# EasyEDA Pro project laterscreen.eprj, board PCB1
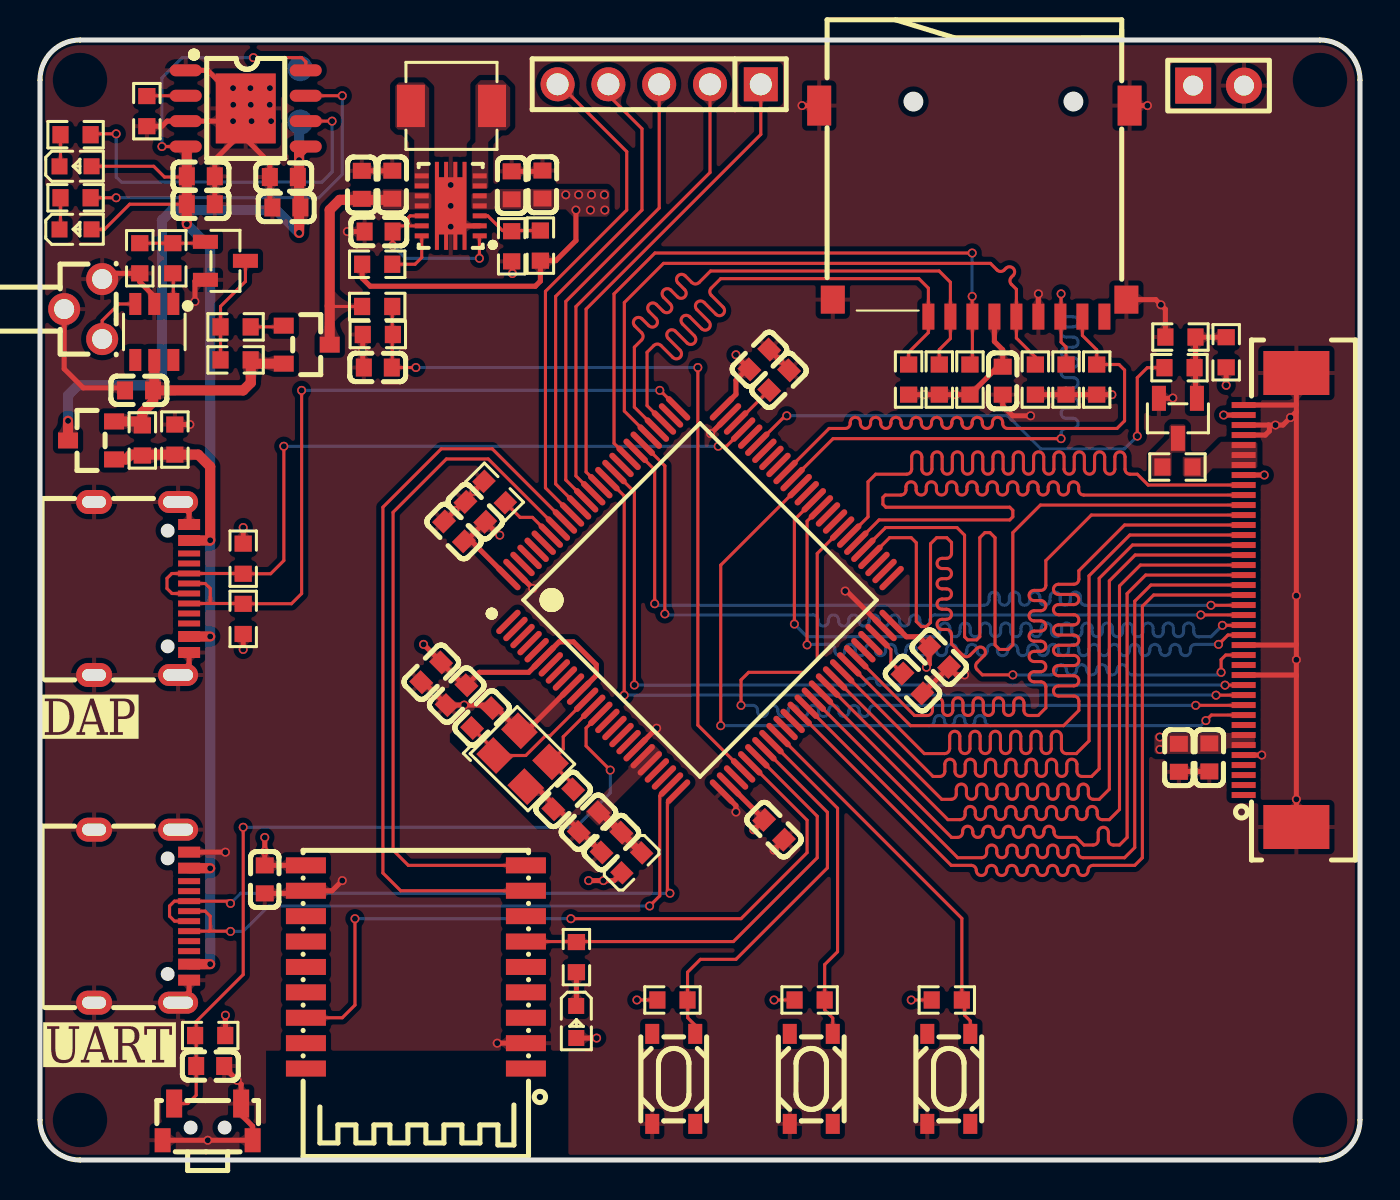
[diagram p3: board, top side]
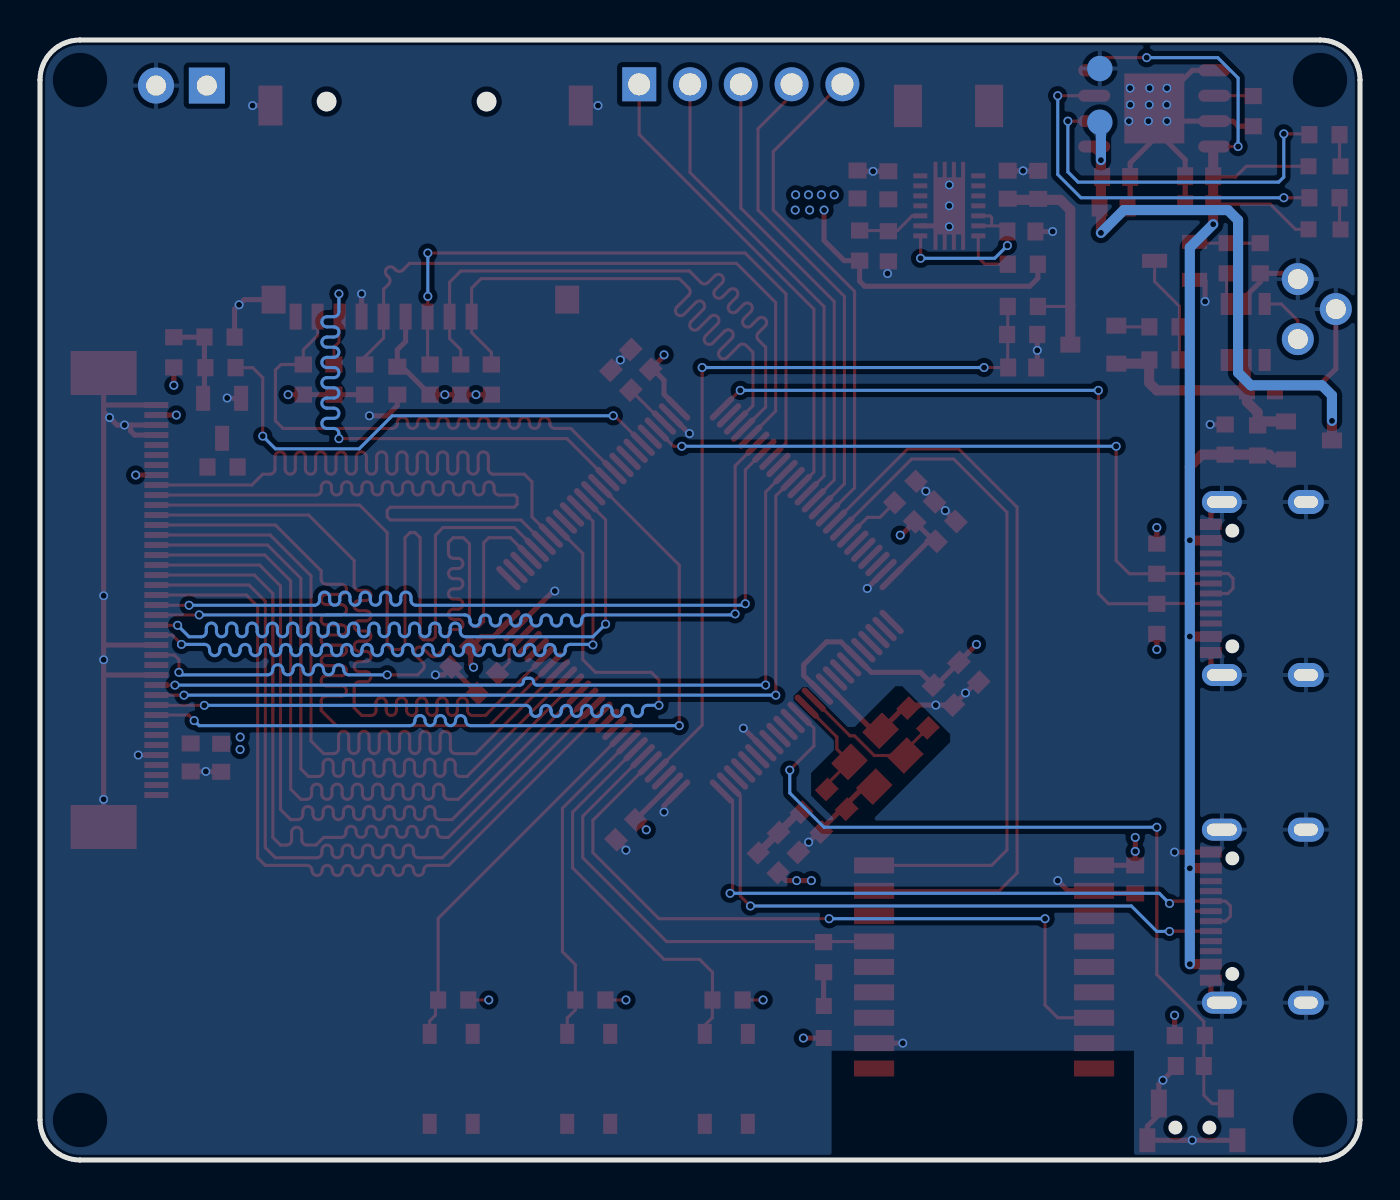
[diagram p4: board, bottom side, seen from below]

Outline 66 x 56 mm; copper layers: Top Layer, Inner1, Inner2, Bottom Layer. Coordinates in mm from the lower left corner of the outline.
Outline path: 0,54 0,2 arc(0.59,0.59) 2,0 64,0 arc(65.41,0.59) 66,2 66,54 arc(65.41,55.41) 64,56 2,56 arc(0.59,55.41) 0,54
Stack: Top Layer 0.035mm 外层铜厚1oz / Dielectric1 0.2104mm 7628 RC49% 8.6mil / Inner1 0.0152mm 内层铜厚 / Dielectric2 1.065mm 1.1mm H/HOZ Copper / Inner2 0.0152mm 内层铜厚 / Dielectric3 0.2104mm 7628 RC49% 8.6mil / Bottom Layer 0.035mm 外层铜厚1oz

## Design rules (mm)
template: 自定义配置
spacing copperThickness1oz (default): track to track 0.102, other pairs 0.089 to 0.3
spacing copperThickness2oz: track to track 0.203, other pairs 0.152 to 0.3
track width copperThickness1oz (default): min 0.102, default 0.155, max 2.54
track width copperThickness2oz: min 0.203, default 0.254, max 2.54
differential pair differentialPair (default): width min 0.127, default 0.254, max 2.54; gap min 0.152, default 0.152
via viaSize (default): diameter min 0.432, default 0.45, max 10; hole min 0.3, default 0.3, max 6.299
net FMC_NE1 uses LCD
net FMC_A16 uses LCD
net FMC_NWE uses LCD
net FMC_NOE uses LCD
net PB15 uses LCD
net FMC_D0 uses LCD
net FMC_D1 uses LCD
net FMC_D2 uses LCD
net FMC_D3 uses LCD
net FMC_D4 uses LCD
net FMC_D5 uses LCD
net FMC_D6 uses LCD
net FMC_D7 uses LCD
net FMC_D8 uses LCD
net FMC_D9 uses LCD
net FMC_D10 uses LCD
net FMC_D11 uses LCD
net FMC_D12 uses LCD
net FMC_D13 uses LCD
net FMC_D14 uses LCD
net FMC_D15 uses LCD
eq len grp LCD uses LCD

## Placement (name value [footprint] x y rotation side)
C20  100nF  [C0603]  20.83 23.24 225 top
C21  2.2uF  [C0603]  36.96 38.99 45 top
C22  100nF  [C0603]  19.56 24.38 225 top
C23  100nF  [C0603]  20.7 31.43 135 top
C24  2.2uF  [C0603]  43.62 23.83 135 top
C25  100nF  [C0603]  27.43 16.89 45 top
C26  10uF  [C0603]  28.57 15.88 45 top
C27  100nF  [C0603]  36.7 16.51 315 top
C28  100nF  [C0603]  35.97 40.03 225 top
C29  100nF  [C0603]  44.96 25.15 135 top
C30  22pF  [C0603]  22.1 22.1 225 top
C31  22pF  [C0603]  26.16 18.03 45 top
C32  1uF  [C0603]  8.51 4.7 180 top
C38  100nF  [C0603]  11.24 14.03 90 top
C39  100nF  [C0603]  58.47 20.13 90 top
C40  100nF  [C0603]  56.94 20.11 270 top
C42  100nF  [C0603]  48.14 38.97 90 top
C43  100nF  [C0603]  21.77 32.41 315 top
C94  100nF  [C0603]  4.95 38.48 0 top
C96  100nF  [C0603]  16.89 39.62 0 top
C99  100nF  [C0603]  16.09 48.76 90 top
C100  10uF  [C0603]  17.61 48.77 90 top
C101  100nF  [C0603]  16.93 46.42 180 top
C102  100nF  [C0603]  25.12 48.77 90 top
C103  10uF  [C0603]  23.58 48.73 90 top
C104  100nF  [C0603]  12.19 49.15 0 top
C105  10uF  [C0603]  12.32 47.62 0 top
C106  100nF  [C0603]  8.04 47.79 180 top
C107  10uF  [C0603]  8.04 49.19 180 top
CARD1  TF-01A  [TF-SMD_TF-01A]  46.72 47.44 180 top
FPC1  AFC07-S40ECA-00  [FPC-SMD_P0.50-40P_LCS-SJ-H2.0]  61.5 28 270 top
H1  -  [HDR-TH_5P-P2.54-V-M]  30.96 53.79 180 top
H2  -  [HDR-TH_2P-P2.54-V-M-1]  58.93 53.72 0 top
L1  2.2uH  [IND-SMD_L4.4-W4.2]  20.57 52.7 0 top
L3  MPZ1608S181ATAH0  [L0603]  29.59 14.86 45 top
LED2  -  [LED_0603]  26.82 6.85 270 top
LED3  -  [LED_0603]  1.83 49.69 0 top
LED4  -  [LED_0603]  1.83 46.54 0 top
Q2  SS8050  [SOT-23-3_L2.9-W1.3-P1.90-LS2.4-BR]  56.9 37.08 90 top
Q3  AO3401A  [SOT-23_L2.9-W1.3-P1.90-LS2.4-BR]  13.34 40.77 180 top
Q4  AO3401A  [SOT-23_L2.9-W1.3-P1.90-LS2.4-BR]  2.55 35.98 0 top
R3  10kΩ  [R0603]  5.34 52.44 90 top
R8  10K  [R0603]  10.16 30.07 90 top
R10  10K  [R0603]  10.16 27.06 270 top
R17  10K  [R0603]  44.96 39.02 270 top
R18  10K  [R0603]  43.43 39.02 270 top
R19  10K  [R0603]  52.84 39.02 270 top
R20  10K  [R0603]  51.3 39.02 270 top
R24  10K  [R0603]  22.73 33.4 315 top
R25  10K  [R0603]  8.51 6.22 0 top
R32  2R2  [R0603]  56.87 34.65 0 top
R33  10K  [R0603]  59.31 40.39 270 top
R34  1K  [R0603]  56.98 39.62 0 top
R35  10K  [R0603]  57.02 41.15 0 top
R36  2K  [R0603]  26.82 10.14 270 top
R37  10K  [R0603]  46.5 39.02 270 top
R38  10K  [R0603]  49.77 39.02 270 top
R91  680R  [R0603]  1.78 48.11 180 top
R92  680R  [R0603]  1.78 51.27 180 top
R100  10K  [R0603]  9.78 40 0 top
R101  10K  [R0603]  4.99 45.09 90 top
R102  1K  [R0603]  6.64 45.09 90 top
R103  1K  [R0603]  9.78 41.66 180 top
R112  10K  [R0603]  45.34 8 180 top
R113  5K  [R0603]  16.86 42.68 0 top
R114  20K  [R0603]  16.89 41.28 0 top
R122  0  [R0603]  5.12 35.98 90 top
R123  1M  [R0603]  16.86 44.79 0 top
R124  1M  [R0603]  25.02 45.72 270 top
R125  180K  [R0603]  23.58 45.69 90 top
R126  10kΩ  [R0603]  6.74 36.02 270 top
R127  10K  [R0603]  38.48 8 180 top
R128  10K  [R0603]  31.62 8 180 top
SW2  TS24CA 250gf 013  [SW-SMD_L4.7-W3.5-P3.35-EH]  8.38 1.91 180 top
SW3  TS3425BA  [SW-SMD_4P-L4.2-W3.2-P2.15-LS4.6-1]  38.56 4.06 90 top
SW4  GT-TCB73B-H090-L1  [SW-TH_G-SWITCH_GT-TCB73B-H090-L1]  2.16 42.55 270 top
SW5  TS3425BA  [SW-SMD_4P-L4.2-W3.2-P2.15-LS4.6-1]  45.44 4.06 90 top
SW6  TS3425BA  [SW-SMD_4P-L4.2-W3.2-P2.15-LS4.6-1]  31.69 4.06 90 top
TP10  -  [Test-Point-0.5mm]  13.01 51.89 0 top
TP11  -  [Test-Point-0.5mm]  13.01 54.57 0 top
U3  STM32H743VIT6  [LQFP-100_L14.0-W14.0-P0.50-LS16.0-BL]  33 28 315 top
U11  TP4056X-42-ESOP8  [SOP-8_L4.9-W3.9-P1.27-LS6.0-TL-EP]  10.29 52.58 0 top
U23  SS8050  [SOT-23-3_L2.9-W1.3-P1.90-LS2.4-BR]  9.27 44.96 180 top
U24  -  [SOT-23-6_L2.9-W1.6-P0.95-LS2.7-BR]  5.72 41.4 90 top
U29  TPS63020DSJR  [VSON-14_L4.0-W3.0-P0.50-BL-EP_TI_DSJ]  20.54 47.71 90 top
U30  RC6621A  [BULETM-SMD_18P-L15.2-W11.2-P1.27]  18.8 9.65 180 top
USB1  TYPE-C 16PIN 2MD(073)  [USB-C-SMD_TYPE-C-6PIN-2MD-073]  5.08 28.58 270 top
USB2  TYPE-C 16PIN 2MD(073)  [USB-C-SMD_TYPE-C-6PIN-2MD-073]  5.08 12.19 270 top
X2  12MHz  [OSC-SMD_4P-L3.2-W2.5-BL]  24.13 20.07 315 top

## Footprints (pads in the part's own frame, mm; a bottom-side part is the same pattern mirrored in y, then rotated)
BULETM-SMD_18P-L15.2-W11.2-P1.27
  rect 2x0.8 smd: 1(-5.5,5.08) 2(-5.5,3.81) 3(-5.5,2.54) 4(-5.5,1.27) 5(-5.5,0) 6(-5.5,-1.27) 7(-5.5,-2.54) 8(-5.5,-3.81) 9(-5.5,-5.08) 10(5.5,-5.08) 11(5.5,-3.81) 12(5.5,-2.54) 13(5.5,-1.27) 14(5.5,0) 15(5.5,1.27) 16(5.5,2.54) 17(5.5,3.81) 18(5.5,5.08)
C0603
  rect 0.8x0.9 smd: 1(-0.7,0) 2(0.7,0)
FPC-SMD_P0.50-40P_LCS-SJ-H2.0
  rect 0.3x1.2 smd: 1(9.751,-1.318) 2(9.252,-1.318) 3(8.753,-1.318) 4(8.252,-1.318) 5(7.752,-1.318) 6(7.252,-1.318) 7(6.752,-1.318) 8(6.251,-1.318) 9(5.753,-1.318) 10(5.253,-1.318) 11(4.753,-1.318) 12(4.252,-1.318) 13(3.752,-1.318) 14(3.251,-1.318) 15(2.752,-1.318) 16(2.253,-1.318) 17(1.752,-1.318) 18(1.252,-1.318) 19(0.752,-1.318) 20(0.252,-1.318) 21(-0.249,-1.318) 22(-0.748,-1.318) 23(-1.247,-1.318) 24(-1.748,-1.318) 25(-2.248,-1.318) 26(-2.748,-1.318) 27(-3.248,-1.318) 28(-3.749,-1.318) 29(-4.247,-1.318) 30(-4.747,-1.318) 31(-5.247,-1.318) 32(-5.748,-1.318) 33(-6.248,-1.318) 34(-6.749,-1.318) 35(-7.248,-1.318) 36(-7.747,-1.318) 37(-8.248,-1.318) 38(-8.748,-1.318) 39(-9.248,-1.318) 40(-9.748,-1.318)
  rect 2.2x3.3 smd: 41(11.35,1.318) 42(-11.35,1.318)
HDR-TH_2P-P2.54-V-M-1
  rect 1.8x1.8 hole 1: 1(-1.27,0)
  round 1.8 hole 1: 2(1.27,0)
HDR-TH_5P-P2.54-V-M
  rect 1.7x1.7 hole 1.1: 1(-5.08,0)
  round 1.7 hole 1.1: 2(-2.54,0) 3(0,0) 4(2.54,0) 5(5.08,0)
IND-SMD_L4.4-W4.2
  rect 1.4x2.12 smd: 1(2.028,0) 2(-2.028,0)
L0603
  rect 0.8x0.864 smd: 1(-0.7,0) 2(0.7,0)
LED_0603
  rect 0.8x0.8 smd: 1(-0.851,-0.01) 2(0.75,-0.005)
LQFP-100_L14.0-W14.0-P0.50-LS16.0-BL
  oval 0.3x1.6 smd: 1(-6,-7.55) 2(-5.5,-7.55) 3(-5,-7.55) 4(-4.5,-7.55) 5(-4,-7.55) 6(-3.5,-7.55) 7(-3,-7.55) 8(-2.5,-7.55) 9(-2,-7.55) 10(-1.5,-7.55) 11(-1,-7.55) 12(-0.5,-7.55) 13(0,-7.55) 14(0.5,-7.55) 15(1,-7.55) 16(1.5,-7.55) 17(2,-7.55) 18(2.5,-7.55) 19(3,-7.55) 20(3.5,-7.55) 21(4,-7.55) 22(4.5,-7.55) 23(5,-7.55) 24(5.5,-7.55) 25(6,-7.55) 51(6,7.55) 52(5.5,7.55) 53(5,7.55) 54(4.5,7.55) 55(4,7.55) 56(3.5,7.55) 57(3,7.55) 58(2.5,7.55) 59(2,7.55) 60(1.5,7.55) 61(1,7.55) 62(0.5,7.55) 63(0,7.55) 64(-0.5,7.55) 65(-1,7.55) 66(-1.5,7.55) 67(-2,7.55) 68(-2.5,7.55) 69(-3,7.55) 70(-3.5,7.55) 71(-4,7.55) 72(-4.5,7.55) 73(-5,7.55) 74(-5.5,7.55) 75(-6,7.55)
  oval 1.6x0.3 smd: 26(7.55,-6) 27(7.55,-5.5) 28(7.55,-5) 29(7.55,-4.5) 30(7.55,-4) 31(7.55,-3.5) 32(7.55,-3) 33(7.55,-2.5) 34(7.55,-2) 35(7.55,-1.5) 36(7.55,-1) 37(7.55,-0.5) 38(7.55,0) 39(7.55,0.5) 40(7.55,1) 41(7.55,1.5) 42(7.55,2) 43(7.55,2.5) 44(7.55,3) 45(7.55,3.5) 46(7.55,4) 47(7.55,4.5) 48(7.55,5) 49(7.55,5.5) 50(7.55,6) 76(-7.55,6) 77(-7.55,5.5) 78(-7.55,5) 79(-7.55,4.5) 80(-7.55,4) 81(-7.55,3.5) 82(-7.55,3) 83(-7.55,2.5) 84(-7.55,2) 85(-7.55,1.5) 86(-7.55,1) 87(-7.55,0.5) 88(-7.55,0) 89(-7.55,-0.5) 90(-7.55,-1) 91(-7.55,-1.5) 92(-7.55,-2) 93(-7.55,-2.5) 94(-7.55,-3) 95(-7.55,-3.5) 96(-7.55,-4) 97(-7.55,-4.5) 98(-7.55,-5) 99(-7.55,-5.5) 100(-7.55,-6)
OSC-SMD_4P-L3.2-W2.5-BL
  rect 1.4x1.2 smd: 1(-1.1,-0.875) 2(1.1,-0.875) 3(1.1,0.875) 4(-1.1,0.875)
R0603
  rect 0.806x0.864 smd: 1(-0.753,0) 2(0.753,0)
SOP-8_L4.9-W3.9-P1.27-LS6.0-TL-EP
  oval 1.6x0.6 smd: 1(-3,1.905) 2(-3,0.635) 3(-3,-0.635) 4(-3,-1.905) 5(3,-1.905) 6(3,-0.635) 7(3,0.635) 8(3,1.905)
  rect 3x3.5 smd: 9(0,0)
SOT-23-3_L2.9-W1.3-P1.90-LS2.4-BR
  rect 1.25x0.7 smd: 1(1,-0.95) 2(1,0.95) 3(-1,0)
SOT-23-6_L2.9-W1.6-P0.95-LS2.7-BR
  rect 1.1x0.6 smd: 1(1.4,-0.95) 2(1.4,0) 3(1.4,0.95) 4(-1.4,0.95) 5(-1.4,0) 6(-1.4,-0.95)
SOT-23_L2.9-W1.3-P1.90-LS2.4-BR
  rect 1x0.8 smd: 1(1.15,-0.95) 2(1.15,0.95) 3(-1.15,0)
SW-SMD_4P-L4.2-W3.2-P2.15-LS4.6-1
  rect 1x0.7 smd: 1(-2.25,1.075) 2(2.25,1.075) 3(-2.25,-1.075) 4(2.25,-1.075)
SW-SMD_L4.7-W3.5-P3.35-EH
  rect 0.8x1.4 smd: 1(-1.675,-0.917) 2(1.675,-0.917)
  rect 0.8x1.2 smd: 3(-2.25,0.917) 4(2.25,0.917)
SW-TH_G-SWITCH_GT-TCB73B-H090-L1
  round 1.6 hole 1: 1(-1.5,0.95) 2(1.5,0.95) 3(0,-0.95)
Test-Point-0.5mm
  round 1.27 smd far side: 1(0,0)
TF-SMD_TF-01A
  rect 0.6x1.3 smd: 1(2.3,5.276) 2(1.2,5.276) 3(0.101,5.276) 4(-1,5.276) 5(-2.099,5.276) 6(-3.2,5.276) 7(-4.3,5.276) 8(-5.399,5.276) 9(-6.5,5.276)
  rect 1.2x1.4 smd: 10(-7.599,4.426) 13(7.08,4.426)
  rect 1.2x2 smd: 11(-7.76,-5.276) 12(7.76,-5.276)
USB-C-SMD_TYPE-C-6PIN-2MD-073
  rect 0.55x1.1 smd: 1(-3.2,2.375) 2(-2.4,2.375) 11(2.4,2.375) 12(3.2,2.375)
  rect 0.3x1.1 smd: 3(-1.75,2.375) 4(-1.25,2.375) 5(-0.75,2.375) 6(-0.25,2.375) 7(0.25,2.375) 8(0.75,2.375) 9(1.25,2.375) 10(1.75,2.375)
  oval 1.1x2 hole 0.6x1.5: 13(-4.325,1.825) 14(4.325,1.825)
  oval 1.2x1.8 hole 0.6x1.2: 13(-4.325,-2.375) 14(4.325,-2.375)
VSON-14_L4.0-W3.0-P0.50-BL-EP_TI_DSJ
  rect 0.25x0.7 smd: 1(-1.5,-1.45) 2(-1,-1.45) 3(-0.5,-1.45) 4(0,-1.45) 5(0.5,-1.45) 6(1,-1.45) 7(1.5,-1.45) 8(1.5,1.45) 9(1,1.45) 10(0.5,1.45) 11(0,1.45) 12(-0.5,1.45) 13(-1,1.45) 14(-1.5,1.45)
  custom 4.4x1.58 smd: 15(0,0)

## Nets
As in the schematic.

Pads without a net: CARD1 9; FPC1 1 2 3 4 8 14; SW3 2 3; SW5 2 3; SW6 2 3; U3 1 2 3 4 5 7 8 9 15 16 17 18 22 23 28 35 36 46 47 51 52 53 59 60 63 67 68 69 71 77 84 95 96 97 98; U24 4 6; U30 1 3 4 5 7 12 13 14 15 17 18; USB1 3 4 9 10; USB2 3 4 9 10

## Via types
v1: diameter 0.45, hole 0.299, Top Layer to Bottom Layer, 135 vias

## Routing (per net, layer and track width the routed paths; a pad name or vN(x,y) marks a point on that pad's centre or on a via; arc(x,y) is an arc through that point)
5V: length 11.7
  Top Layer w0.155: R113.1 14.51,42.68 14.49,42.7
  Top Layer w0.508: Q3.3 14.49,47.5 14.99,48.01 17.56,48.01 C100.1
+5V: length 12.9
  Top Layer w0.508: C94.2 5.72,38.54 U24.5 ; C94.2 10.16,38.48 10.54,38.86 10.54,40 ; C94.2 5.65,37.91 5.12,37.37 R122.2 4.92,36.93 Q4.2 ; Q3.2 10.72,39.82 10.54,40 ; 10.54,40 R100.2
GND: length 136.9
  Top Layer w0.254: R126.1 v1(7.49,36.77) ; FPC1.38 61.43,36.75 ; 61.43,36.75 v1(61.77,36.75) 62.15,36.75 v1(62.52,37.12) 62.82,37.42 ; 61.43,36.75 61.47,36.71 61.47,36.45 61.27,36.25 FPC1.37 ; C39.1 v1(57.71,19.43) 56.96,19.43 C40.2 ; 24.29,18.67 24.79,18.67 v1(27.57,15.89) C26.1 ; C100.2 17.61,49.46 v1(16.85,49.46) C99.2 ; 62.82,25.77 62.79,25.75 FPC1.16 ; 62.82,25.77 v1(62.82,25.01) 62.82,24.24 ; 62.82,25.77 v1(62.82,28.21) 62.82,37.42 ; 45.44,24.64 44.13,23.33 C24.1 ; 45.44,24.64 C29.1 ; 45.44,24.64 45.82,24.26 v1(46.23,24.26) ; R35.1 56.27,42.54 v1(56.05,42.76) 55.79,43.02 54.32,43.02 ; 19.06,23.89 19.19,23.89 v1(19.72,23.35) 20.33,22.75 v1(21.21,22.75) 22.44,22.75 C30.1 22.84,22.59 23.97,21.46 24.34,21.46 U3.10 ; v1(40.26,28.45) 40.33,28.45 U3.49 ; v1(33.53,36.32) 33.54,36.32 U3.74 ; USB1.14 7.45,24.8 USB1.12 ; U3.99 24.64,28.58 v1(24.64,28.58) ; R114.1 v1(16.14,40.48) 16.14,39.68 C96.1 ; 6.91,7.87 7.45,8.42 USB2.12 ; U11.9 v1(9.65,51.94) U11.3 6.35,51.94 6.1,51.69 R3.1 ; U11.9 8.38,54.48 U11.1 ; U11.9 10.29,51.05 ; SW2.4 v1(8.39,0.99) SW2.3 10.63,1.69 10.06,2.26 10.06,3.79 v1(9.85,3.99) 9.21,4.63 C32.1 ; U29.2 20.58,46.71 v1(20.54,46.67) ; CARD1.11 v1(55.37,52.72) ; FPC1.5 v1(61.09,20.25) ; FPC1.41 v1(62.82,18.03) 62.82,24.24 ; USB2.1 v1(9.27,15.39) ; v1(23.62,44.32) 23.62,44.89 R125.1 ; v1(34.8,17.4) 34.8,17.72 34.1,18.42 ; C103.2 v1(24.35,49.43) 25.08,49.43 C102.2 ; C94.1 4.13,38.61 2.16,38.61 1.21,39.56 SW4.3 ; C21.2 37.45,39.53 v1(36.98,40) 36.46,40.52 ; v1(49.53,37.21) 48.64,37.21 48.14,37.72 C42.1 ; v1(7.75,42.93) 7.75,43.94 7.81,44.01 U23.2 ; FPC1.13 62.81,24.25 62.82,24.24 ; 3.11,44.05 3.4,44.33 R101.1 4.99,43.91 5.72,43.18 U24.2 ; v1(56.64,38.1) 56.63,38.08 Q2.2 ; 62.82,37.42 62.82,37.77 ; C105.1 11.49,47.75 C104.1 11.49,49.85 10.29,51.05 ; 62.82,37.77 62.8,37.75 FPC1.40 ; 62.82,37.77 FPC1.42 ; USB1.1 7.45,32.35 USB1.13 ; 10.29,51.05 9.78,51.05 8.74,50.02 C107.1 C106.1 ; C101.2 v1(15.37,46.42) ; C27.2 36.7,15.52 v1(36.7,15.49) ; R24.1 v1(21.71,33.44) v1(20.74,32.47) 20.2,31.94 C23.2 ; v1(15.11,13.97) 14.6,13.46 U30.11 13.17,13.33 C38.1 ; CARD1.12 v1(38.1,52.72) ; U30.2 v1(22.86,5.84) ; U3.19 v1(30.83,21.59) 30.86,21.59 ; CARD1.6 v1(49.92,43.31)
  vias: v1(9.65,53.59) v1(9.66,52.76) v1(10.52,53.59) v1(10.54,52.76) v1(10.58,51.94) v1(11.5,53.59) v1(11.49,52.76) v1(11.56,51.94) v1(20.54,48.75) v1(20.54,47.71)
VBAT: length 29
  Top Layer w0.508: U11.5 12.95,50.34 v1(12.95,49.99) v1(12.95,46.36) ; Q4.3 v1(1.4,36.96)
  Bottom Layer w0.508: v1(12.95,46.36) 11.81,47.5 6.6,47.5 6.1,46.99 6.1,39.37 5.46,38.73 1.91,38.73 1.4,38.23 v1(1.4,36.96) ; v1(12.95,49.99) 12.95,51.84 TP10.1
VBUS: length 77.5
  Top Layer w0.155: C106.2 4.48,47.79 3.22,46.53 LED4.2 ; U11.4 v1(6.1,50.67) ; C107.2 7.3,49.15 6.22,49.15 5.69,49.69 LED3.2 ; U11.8 13.29,54.91 13.08,55.12 v1(10.67,55.12)
  Top Layer w0.508: USB2.11 v1(8.51,9.79) ; U11.4 7.34,50.62 C107.2 C106.2 v1(7.34,46.79) ; Q4.1 4.29,35.03 4.53,35.27 R126.2 7.91,35.27 8.51,34.67 v1(8.51,30.99) 8.5,30.97 USB1.2 ; USB1.11 v1(8.51,26.17) ; USB2.2 8.51,14.59
  Bottom Layer w0.155: v1(6.1,50.67) 6.1,54.1 7.11,55.12 v1(10.67,55.12)
  Bottom Layer w0.508: v1(7.34,46.79) 8.51,45.62 v1(8.51,30.99) v1(8.51,26.17) v1(8.51,14.58) v1(8.51,9.79)
VCC3V3: length 69.6
  Top Layer w0.155: R112.2 v1(43.56,8) ; R127.2 v1(36.7,8) ; R128.2 v1(29.84,8)
  Top Layer w0.254: v1(22.99,31.24) 22.93,31.24 22.26,31.91 21.29,30.94 ; R38.2 R20.2 R19.2 v1(53.59,38.27) ; FPC1.39 v1(59.18,37.25) ; v1(27.43,13.97) v1(28.17,13.97) 28.7,13.97 L3.1 ; R25.2 9.27,6.23 v1(9.27,7.24) ; v1(11.24,16.13) v1(11.24,15.43) C38.2 U30.10 ; R18.2 v1(44.2,38.27) R17.2 v1(45.76,38.27) R37.2 47.89,39.67 C42.2 48.14,40.51 47.72,40.93 CARD1.4 ; v1(34.8,40.26) 34.8,40.21 35.47,39.53 35.34,39.53 34.8,38.99 34.8,38.28 34.1,37.58 ; LED2.2 26.82,6.1 v1(27.83,6.1) ; 21.29,30.94 C23.1 ; 21.29,30.94 21.58,30.94 23.42,29.1 ; U3.11 27.81,24.23 27.81,24.77 26.67,25.91 25.96,25.91 U3.6 24.43,24.38 21.97,24.38 21.32,23.74 21.2,23.74 20.05,24.88 20.05,24.91 v1(19.18,25.78) ; R10.2 v1(10.16,25.53) ; 35.71,16.51 v1(35.69,16.51) 36.18,17 C27.1 36.21,17.01 U3.27 ; v1(26.8,47.5) 26.8,45.97 25.79,44.97 R124.2 25.02,43.94 24.76,43.69 16.51,43.69 16.11,44.09 R123.1 ; FPC1.33 v1(61.21,34.25) ; v1(44.32,24.64) 44.46,24.78 C29.2 43.94,26.16 43.32,26.16 42.58,26.9 ; R33.2 v1(59.31,38.73) ; R8.2 v1(10.16,31.62)
  vias: v1(26.29,48.26) v1(26.93,48.26) v1(27.52,47.5) v1(27.58,48.26) v1(28.22,48.26) v1(28.24,47.5) v1(55.99,21.15) v1(56,20.53)
BLUE_BRTS: length 36.7
  Top Layer w0.155: v1(15.75,12.06) 15.75,7.75 15.11,7.11 U30.16 ; U3.30 38.35,16.99 38.35,15.37 35.05,12.06 v1(26.54,12.06)
  Bottom Layer w0.155: v1(26.54,12.06) v1(15.75,12.06)
BLUE_LINK: length 22.6
  Top Layer w0.155: U30.6 34.67,10.92 38.86,15.11 38.86,17.19 U3.31
BLUE_RX: length 37.6
  Top Layer w0.155: U3.92 22.61,35.56 20.07,35.56 17.15,32.64 17.15,14.35 18.03,13.46 U30.8
BLUE_TX: length 34.6
  Top Layer w0.155: U3.93 22.41,35.05 20.32,35.05 17.65,32.39 17.65,15.49 18.41,14.73 U30.9
BOOT0: length 3
  Top Layer w0.155: U3.94 24.63,32.13 24,32.13 R24.2
CHRG: length 18.8
  Top Layer w0.155: R91.1 v1(3.81,48.11) ; v1(15.11,53.21) 13.29,53.21
  Bottom Layer w0.155: v1(15.11,53.21) 15.11,49.28 13.95,48.11 v1(3.81,48.11)
DBUG_RX: length 32
  Top Layer w0.155: v1(9.53,11.43) 9.51,11.44 8.45,11.44 ; v1(30.48,12.7) 30.99,13.21 30.99,18.21 U3.24 ; 8.45,11.44 8.51,11.5 8.51,12.19 8.26,12.44 USB2.6 ; 8.45,11.44 USB2.8
  Bottom Layer w0.155: v1(30.48,12.7) 11.43,12.7 10.16,11.43 v1(9.53,11.43)
DBUG_TX: length 32.3
  Top Layer w0.155: USB2.7 6.73,11.94 6.48,12.19 6.48,12.7 6.72,12.94 USB2.5 9.41,12.94 v1(9.53,12.83) ; v1(31.5,13.33) 31.37,13.46 31.37,17.88 31.9,18.42
  Bottom Layer w0.155: v1(9.53,12.83) 10.03,13.33 v1(31.5,13.33)
FMC_A16: length 41.8
  Top Layer w0.155: U3.58 38.86,30.33 38.86,25.02 38.23,24.38 35.43,24.38 35.05,24 v1(35.05,22.73) ; v1(57.78,22.73) 60.17,22.73 FPC1.10
  Bottom Layer w0.155: v1(35.05,22.73) 35.62,22.73 arc(35.8,22.66) 35.88,22.48 35.88,22.43 arc(36.13,22.17) 36.38,22.43 36.38,22.48 arc(36.64,22.73) 36.89,22.48 36.89,22.43 arc(37.15,22.17) 37.4,22.43 37.4,22.48 arc(37.65,22.73) 37.91,22.48 37.91,22.43 arc(38.16,22.17) 38.42,22.43 38.42,22.48 arc(38.67,22.73) 38.92,22.48 38.92,22.43 arc(39.18,22.17) 39.43,22.43 39.43,22.48 arc(39.69,22.73) 39.94,22.48 39.94,22.43 arc(40.19,22.17) 40.45,22.43 40.45,22.48 arc(40.7,22.73) 40.96,22.48 40.96,22.43 arc(41.21,22.17) 41.46,22.43 41.46,22.48 arc(41.54,22.66) 41.72,22.73 v1(57.78,22.73)
FMC_D0: length 41.7
  Top Layer w0.155: FPC1.17 59.39,26.25 v1(58.93,25.78) ; v1(38.35,25.76) 38.35,31.94 U3.61
  Bottom Layer w0.155: v1(58.93,25.78) 57.78,25.78 arc(57.6,25.71) 57.52,25.53 57.52,25.47 arc(57.27,25.22) 57.01,25.47 57.01,25.53 arc(56.76,25.78) 56.51,25.53 56.51,25.47 arc(56.25,25.22) 56,25.47 56,25.53 arc(55.74,25.78) 55.49,25.53 55.49,25.47 arc(55.24,25.22) 54.98,25.47 54.98,25.53 arc(54.73,25.78) 54.47,25.53 54.47,25.47 arc(54.22,25.22) 53.97,25.47 53.97,25.53 arc(53.71,25.78) 53.46,25.53 53.46,25.47 arc(53.2,25.22) 52.95,25.47 52.95,25.53 arc(52.7,25.78) 52.44,25.53 52.44,25.47 arc(52.19,25.22) 51.93,25.47 51.93,25.53 arc(51.68,25.78) 51.43,25.53 51.43,25.47 arc(51.17,25.22) 50.92,25.47 50.92,25.53 arc(50.66,25.78) 50.41,25.53 50.41,25.47 arc(50.16,25.22) 49.9,25.47 49.9,25.53 arc(49.65,25.78) 49.39,25.53 49.39,25.47 arc(49.14,25.22) 48.89,25.47 48.89,25.53 arc(48.63,25.78) 48.38,25.53 48.38,25.47 arc(48.12,25.22) 47.87,25.47 47.87,25.53 arc(47.62,25.78) 47.36,25.53 47.36,25.47 arc(47.11,25.22) 46.85,25.47 46.85,25.53 arc(46.6,25.78) 46.35,25.53 46.35,25.47 arc(46.09,25.22) 45.84,25.47 45.84,25.53 arc(45.58,25.78) 45.33,25.53 45.33,25.47 arc(45.08,25.22) 44.82,25.47 44.82,25.53 arc(44.57,25.78) 44.31,25.53 44.31,25.47 arc(44.06,25.22) 43.81,25.47 43.81,25.53 arc(43.55,25.78) 43.3,25.53 43.3,25.47 arc(43.04,25.22) 42.79,25.47 42.79,25.53 arc(42.54,25.78) 42.28,25.53 42.28,25.47 arc(42.03,25.22) 41.77,25.47 41.77,25.53 arc(41.52,25.78) 41.27,25.53 41.27,25.47 arc(41.01,25.22) 40.76,25.47 40.76,25.53 arc(40.5,25.78) 40.25,25.53 40.25,25.47 arc(40,25.22) 39.74,25.47 39.74,25.53 arc(39.67,25.71) 39.49,25.78 38.38,25.78 v1(38.35,25.76)
FMC_D1: length 41.7
  Top Layer w0.155: FPC1.18 60.17,26.73 v1(59.12,26.73) ; v1(37.72,26.8) 37.72,32.01 38.69,32.98
  Bottom Layer w0.155: v1(59.12,26.73) 58.55,26.16 57.94,26.16 arc(57.76,26.24) 57.69,26.42 57.69,26.59 arc(57.43,26.85) 57.18,26.59 57.18,26.42 arc(56.92,26.16) 56.67,26.42 56.67,26.59 arc(56.41,26.85) 56.16,26.59 56.16,26.42 arc(55.91,26.16) 55.65,26.42 55.65,26.59 arc(55.4,26.85) 55.15,26.59 55.15,26.42 arc(54.89,26.16) 54.64,26.42 54.64,26.59 arc(54.38,26.85) 54.13,26.59 54.13,26.42 arc(53.88,26.16) 53.62,26.42 53.62,26.59 arc(53.37,26.85) 53.11,26.59 53.11,26.42 arc(52.86,26.16) 52.6,26.42 52.6,26.59 arc(52.35,26.85) 52.1,26.59 52.1,26.42 arc(51.84,26.16) 51.59,26.42 51.59,26.59 arc(51.34,26.85) 51.08,26.59 51.08,26.42 arc(50.83,26.16) 50.57,26.42 50.57,26.59 arc(50.32,26.85) 50.06,26.59 50.06,26.42 arc(49.81,26.16) 49.56,26.42 49.56,26.59 arc(49.3,26.85) 49.05,26.59 49.05,26.42 arc(48.79,26.16) 48.54,26.42 48.54,26.59 arc(48.29,26.85) 48.03,26.59 48.03,26.42 arc(47.78,26.16) 47.53,26.42 47.53,26.59 arc(47.27,26.85) 47.02,26.59 47.02,26.42 arc(46.76,26.16) 46.51,26.42 46.51,26.59 arc(46.25,26.85) 46,26.59 46,26.42 arc(45.75,26.16) 45.49,26.42 45.49,26.59 arc(45.24,26.85) 44.99,26.59 44.99,26.42 arc(44.91,26.24) 44.73,26.16 38.35,26.16 v1(37.72,26.8)
FMC_D2: length 42
  Top Layer w0.155: v1(31.24,27.31) 31.24,34.71 U3.81 ; v1(58.04,27.25) 60.18,27.25 FPC1.19
  Bottom Layer w0.155: v1(31.24,27.31) 31.29,27.25 38.66,27.25 arc(38.84,27.18) 38.91,27 38.91,26.95 arc(39.17,26.7) 39.42,26.95 39.42,27 arc(39.68,27.25) 39.93,27 39.93,26.95 arc(40.18,26.7) 40.44,26.95 40.44,27 arc(40.69,27.25) 40.94,27 40.94,26.95 arc(41.2,26.7) 41.45,26.95 41.45,27 arc(41.71,27.25) 41.96,27 41.96,26.95 arc(42.22,26.7) 42.47,26.95 42.47,27 arc(42.72,27.25) 42.98,27 42.98,26.95 arc(43.23,26.7) 43.49,26.95 43.49,27 arc(43.74,27.25) 43.99,27 43.99,26.95 arc(44.25,26.7) 44.5,26.95 44.5,27 arc(44.58,27.18) 44.75,27.25 v1(58.04,27.25)
FMC_D3: length 42
  Top Layer w0.155: U3.82 30.73,34.51 v1(30.73,27.81) ; FPC1.20 60.17,27.74 v1(58.55,27.74)
  Bottom Layer w0.155: v1(58.55,27.74) 52.28,27.74 arc(52.1,27.81) 52.03,27.99 52.03,28.14 arc(51.77,28.4) 51.52,28.14 51.52,27.99 arc(51.26,27.74) 51.01,27.99 51.01,28.14 arc(50.75,28.4) 50.5,28.14 50.5,27.99 arc(50.25,27.74) 49.99,27.99 49.99,28.14 arc(49.74,28.4) 49.49,28.14 49.49,27.99 arc(49.23,27.74) 48.98,27.99 48.98,28.14 arc(48.72,28.4) 48.47,28.14 48.47,27.99 arc(48.22,27.74) 47.96,27.99 47.96,28.14 arc(47.71,28.4) 47.45,28.14 47.45,27.99 arc(47.38,27.81) 47.2,27.74 30.81,27.74 v1(30.73,27.81)
FMC_D4: length 41.8
  Top Layer w0.155: FPC1.21 55.68,28.25 55.12,27.69 55.12,15.11 54.74,14.73 52.66,14.73 arc(52.48,14.66) 52.4,14.48 arc(52.15,14.22) 51.9,14.48 arc(51.64,14.73) 51.39,14.48 arc(51.13,14.22) 50.88,14.48 arc(50.62,14.73) 50.37,14.48 arc(50.12,14.22) 49.86,14.48 arc(49.61,14.73) 49.35,14.48 arc(49.1,14.22) 48.85,14.48 arc(48.59,14.73) 48.34,14.48 arc(48.09,14.22) 47.83,14.48 arc(47.58,14.73) 47.32,14.48 arc(47.07,14.22) 46.81,14.48 arc(46.74,14.66) 46.56,14.73 45.56,14.73 37.99,22.31
FMC_D5: length 42
  Top Layer w0.155: FPC1.22 55.54,28.75 54.74,27.94 54.74,15.62 54.23,15.11 52.16,15.11 arc(51.98,15.19) 51.9,15.37 51.9,15.49 arc(51.65,15.75) 51.39,15.49 51.39,15.37 arc(51.14,15.11) 50.89,15.37 50.89,15.49 arc(50.63,15.75) 50.38,15.49 50.38,15.37 arc(50.12,15.11) 49.87,15.37 49.87,15.49 arc(49.62,15.75) 49.36,15.49 49.36,15.37 arc(49.11,15.11) 48.85,15.37 48.85,15.49 arc(48.6,15.75) 48.35,15.49 48.35,15.37 arc(48.09,15.11) 47.84,15.37 47.84,15.49 arc(47.58,15.75) 47.33,15.49 47.33,15.37 arc(47.26,15.19) 47.08,15.11 45.89,15.11 U3.38
FMC_D6: length 42
  Top Layer w0.155: FPC1.23 55.28,29.25 54.36,28.32 54.36,16.13 53.97,15.75 53.67,15.75 arc(53.49,15.82) 53.42,16 53.42,16.38 arc(53.17,16.64) 52.91,16.38 52.91,16 arc(52.84,15.82) 52.66,15.75 52.2,15.75 51.82,16.13 50.96,16.13 arc(50.78,16.2) 50.7,16.38 50.7,16.43 arc(50.45,16.69) 50.19,16.43 50.19,16.38 arc(49.94,16.13) 49.69,16.38 49.69,16.43 arc(49.43,16.69) 49.18,16.43 49.18,16.38 arc(48.92,16.13) 48.67,16.38 48.67,16.43 arc(48.42,16.69) 48.16,16.43 48.16,16.38 arc(47.91,16.13) 47.65,16.38 47.65,16.43 arc(47.4,16.69) 47.15,16.43 47.15,16.38 arc(46.89,16.13) 46.64,16.38 46.64,16.43 arc(46.38,16.69) 46.13,16.43 46.13,16.38 arc(46.06,16.2) 45.88,16.13 45.58,16.13 38.69,23.02
FMC_D7: length 41.8
  Top Layer w0.155: U3.40 45.4,17.02 46,17.02 arc(46.18,17.09) 46.26,17.27 46.26,17.42 arc(46.51,17.68) 46.76,17.42 46.76,17.27 arc(47.02,17.02) 47.27,17.27 47.27,17.42 arc(47.53,17.68) 47.78,17.42 47.78,17.27 arc(48.03,17.02) 48.29,17.27 48.29,17.42 arc(48.54,17.68) 48.8,17.42 48.8,17.27 arc(49.05,17.02) 49.3,17.27 49.3,17.42 arc(49.56,17.68) 49.81,17.42 49.81,17.27 arc(50.07,17.02) 50.32,17.27 50.32,17.42 arc(50.57,17.68) 50.83,17.42 50.83,17.27 arc(51.08,17.02) 51.34,17.27 51.34,17.42 arc(51.59,17.68) 51.84,17.42 51.84,17.27 arc(52.1,17.02) 52.35,17.27 52.35,17.42 arc(52.61,17.68) 52.86,17.42 52.86,17.27 arc(52.93,17.09) 53.11,17.02 53.47,17.02 53.97,17.53 53.97,28.7 55.02,29.75 FPC1.24
FMC_D8: length 41.9
  Top Layer w0.155: FPC1.25 54.76,30.25 53.47,28.96 53.47,18.54 52.96,18.03 52.67,18.03 arc(52.49,18.11) 52.42,18.29 52.42,18.54 arc(52.16,18.8) 51.91,18.54 51.91,18.29 arc(51.66,18.03) 51.4,18.29 51.4,18.54 arc(51.15,18.8) 50.89,18.54 50.89,18.29 arc(50.64,18.03) 50.39,18.29 50.39,18.54 arc(50.13,18.8) 49.88,18.54 49.88,18.29 arc(49.62,18.03) 49.37,18.29 49.37,18.54 arc(49.12,18.8) 48.86,18.54 48.86,18.29 arc(48.61,18.03) 48.35,18.29 48.35,18.54 arc(48.1,18.8) 47.85,18.54 47.85,18.29 arc(47.59,18.03) 47.34,18.29 47.34,18.54 arc(47.08,18.8) 46.83,18.54 46.83,18.29 arc(46.58,18.03) 46.32,18.29 46.32,18.54 arc(46.07,18.8) 45.81,18.54 45.81,18.29 arc(45.74,18.11) 45.56,18.03 45.09,18.03 U3.41
FMC_D9: length 41.9
  Top Layer w0.155: U3.42 44.65,19.18 44.99,19.18 arc(45.17,19.25) 45.24,19.43 45.24,19.79 arc(45.5,20.04) 45.75,19.79 45.75,19.43 arc(46,19.18) 46.26,19.43 46.26,19.79 arc(46.51,20.04) 46.77,19.79 46.77,19.43 arc(47.02,19.18) 47.27,19.43 47.27,19.79 arc(47.53,20.04) 47.78,19.79 47.78,19.43 arc(48.04,19.18) 48.29,19.43 48.29,19.79 arc(48.54,20.04) 48.8,19.79 48.8,19.43 arc(49.05,19.18) 49.31,19.43 49.31,19.79 arc(49.56,20.04) 49.81,19.79 49.81,19.43 arc(50.07,19.18) 50.32,19.43 50.32,19.79 arc(50.58,20.04) 50.83,19.79 50.83,19.43 arc(51.08,19.18) 51.34,19.43 51.34,19.79 arc(51.59,20.04) 51.85,19.79 51.85,19.43 arc(51.92,19.25) 52.1,19.18 52.58,19.18 52.96,19.56 52.96,29.08 54.62,30.75 FPC1.26
FMC_D10: length 41.9
  Top Layer w0.155: FPC1.27 54.49,31.25 52.45,29.21 52.45,20.95 51.82,20.32 51.32,20.32 arc(51.15,20.39) 51.07,20.57 51.07,21.18 arc(50.82,21.44) 50.56,21.18 50.56,20.57 arc(50.31,20.32) 50.06,20.57 50.06,21.18 arc(49.8,21.44) 49.55,21.18 49.55,20.57 arc(49.29,20.32) 49.04,20.57 49.04,21.18 arc(48.78,21.44) 48.53,21.18 48.53,20.57 arc(48.28,20.32) 48.02,20.57 48.02,21.18 arc(47.77,21.44) 47.51,21.18 47.51,20.57 arc(47.26,20.32) 47.01,20.57 47.01,21.18 arc(46.75,21.44) 46.5,21.18 46.5,20.57 arc(46.25,20.32) 45.99,20.57 45.99,21.18 arc(45.74,21.44) 45.48,21.18 45.48,20.57 arc(45.41,20.39) 45.23,20.32 44.22,20.32 U3.43
FMC_D11: length 41.9
  Top Layer w0.155: U3.44 43.53,21.72 51.18,21.72 51.94,22.48 51.94,22.94 arc(51.87,23.12) 51.69,23.2 50.93,23.2 arc(50.67,23.45) 50.93,23.71 51.69,23.71 arc(51.94,23.96) 51.69,24.21 50.93,24.21 arc(50.67,24.47) 50.93,24.72 51.69,24.72 arc(51.94,24.98) 51.69,25.23 50.93,25.23 arc(50.67,25.48) 50.93,25.74 51.69,25.74 arc(51.94,25.99) 51.69,26.25 50.93,26.25 arc(50.67,26.5) 50.93,26.75 51.69,26.75 arc(51.94,27.01) 51.69,27.26 50.93,27.26 arc(50.67,27.52) 50.93,27.77 51.69,27.77 arc(51.94,28.02) 51.69,28.28 50.93,28.28 arc(50.67,28.53) 50.93,28.79 51.69,28.79 arc(51.87,28.86) 51.94,29.04 51.94,29.46 54.23,31.75 FPC1.28
FMC_D12: length 41.9
  Top Layer w0.155: FPC1.29 52.57,32.25 50.29,29.97 50.29,28.73 arc(50.22,28.55) 50.04,28.48 49.71,28.48 arc(49.45,28.23) 49.71,27.97 50.04,27.97 arc(50.29,27.72) 50.04,27.46 49.71,27.46 arc(49.45,27.21) 49.71,26.96 50.04,26.96 arc(50.29,26.7) 50.04,26.45 49.71,26.45 arc(49.45,26.19) 49.71,25.94 50.04,25.94 arc(50.29,25.69) 50.04,25.43 49.71,25.43 arc(49.45,25.18) 49.71,24.92 50.04,24.92 arc(50.29,24.67) 50.04,24.42 49.71,24.42 arc(49.45,24.16) 49.71,23.91 50.04,23.91 arc(50.22,23.83) 50.29,23.65 50.29,22.61 49.91,22.22 49.45,22.22 arc(49.27,22.3) 49.2,22.48 49.2,22.86 arc(48.94,23.11) 48.69,22.86 48.69,22.48 arc(48.43,22.22) 48.18,22.48 48.18,22.86 arc(47.93,23.11) 47.67,22.86 47.67,22.48 arc(47.42,22.22) 47.16,22.48 47.16,22.86 arc(46.91,23.11) 46.66,22.86 46.66,22.48 arc(46.4,22.22) 46.15,22.48 46.15,22.86 arc(45.89,23.11) 45.64,22.86 45.64,22.48 arc(45.39,22.22) 45.13,22.48 45.13,22.86 arc(44.88,23.11) 44.62,22.86 44.62,22.48 arc(44.55,22.3) 44.37,22.22 43.72,22.22 U3.45
FMC_D13: length 41.7
  Top Layer w0.155: FPC1.30 50.02,32.75 48.64,31.37 48.64,25.76 48.41,25.53 47.98,25.53 47.75,25.75 47.75,31.11 47.5,31.37 47.24,31.37 46.99,31.11 46.99,26.16 46.84,26.01 46.38,26.01 46.23,26.16 46.23,31.24 45.85,31.62 42.28,31.62 U3.55
FMC_D14: length 41.7
  Top Layer w0.155: U3.56 41.95,32 48.49,32 48.64,32.16 48.64,32.48 48.49,32.64 42.29,32.64 42.15,32.78 42.15,33.13 42.26,33.25 43.04,33.25 arc(43.22,33.32) 43.3,33.5 43.3,33.66 arc(43.55,33.91) 43.81,33.66 43.81,33.5 arc(44.06,33.25) 44.31,33.5 44.31,33.66 arc(44.57,33.91) 44.82,33.66 44.82,33.5 arc(45.08,33.25) 45.33,33.5 45.33,33.66 arc(45.58,33.91) 45.84,33.66 45.84,33.5 arc(46.09,33.25) 46.35,33.5 46.35,33.66 arc(46.6,33.91) 46.85,33.66 46.85,33.5 arc(47.11,33.25) 47.36,33.5 47.36,33.66 arc(47.62,33.91) 47.87,33.66 47.87,33.5 arc(48.12,33.25) 48.38,33.5 48.38,33.66 arc(48.63,33.91) 48.89,33.66 48.89,33.5 arc(49.14,33.25) 49.39,33.5 49.39,33.66 arc(49.65,33.91) 49.9,33.66 49.9,33.5 arc(50.16,33.25) 50.41,33.5 50.41,33.66 arc(50.66,33.91) 50.92,33.66 50.92,33.5 arc(51.17,33.25) 51.43,33.5 51.43,33.66 arc(51.68,33.91) 51.93,33.66 51.93,33.5 arc(52.01,33.32) 52.19,33.25 FPC1.31
FMC_D15: length 42
  Top Layer w0.155: U3.57 41.4,32.16 41.4,33.91 41.78,34.29 43.33,34.29 arc(43.51,34.36) 43.58,34.54 43.58,35.15 arc(43.84,35.41) 44.09,35.15 44.09,34.54 arc(44.34,34.29) 44.6,34.54 44.6,35.15 arc(44.85,35.41) 45.11,35.15 45.11,34.54 arc(45.36,34.29) 45.62,34.54 45.62,35.15 arc(45.87,35.41) 46.12,35.15 46.12,34.54 arc(46.38,34.29) 46.63,34.54 46.63,35.15 arc(46.88,35.41) 47.14,35.15 47.14,34.54 arc(47.39,34.29) 47.65,34.54 47.65,35.15 arc(47.9,35.41) 48.16,35.15 48.16,34.54 arc(48.41,34.29) 48.66,34.54 48.66,35.15 arc(48.92,35.41) 49.17,35.15 49.17,34.54 arc(49.43,34.29) 49.68,34.54 49.68,35.15 arc(49.93,35.41) 50.19,35.15 50.19,34.54 arc(50.44,34.29) 50.69,34.54 50.69,35.15 arc(50.95,35.41) 51.2,35.15 51.2,34.54 arc(51.46,34.29) 51.71,34.54 51.71,35.15 arc(51.97,35.41) 52.22,35.15 52.22,34.54 arc(52.47,34.29) 52.73,34.54 52.73,35.15 arc(52.98,35.41) 53.24,35.15 53.24,34.54 arc(53.49,34.29) 53.74,34.54 53.74,35.15 arc(54,35.41) 54.25,35.15 54.25,34.54 arc(54.33,34.36) 54.5,34.29 54.86,34.29 55.41,33.75 FPC1.32
FMC_NE1: length 41.7
  Top Layer w0.155: v1(34.04,21.72) 34.04,29.74 37.99,33.69 ; FPC1.9 58.57,22.25 v1(58.29,21.97)
  Bottom Layer w0.155: v1(58.29,21.97) 58.04,21.72 47.51,21.72 arc(47.33,21.79) 47.26,21.97 arc(47,22.22) 46.75,21.97 arc(46.49,21.72) 46.24,21.97 arc(45.99,22.22) 45.73,21.97 arc(45.48,21.72) 45.22,21.97 arc(44.97,22.22) 44.72,21.97 arc(44.64,21.79) 44.46,21.72 v1(34.04,21.72)
FMC_NOE: length 41.9
  Top Layer w0.155: U3.85 29.72,33.4 v1(29.72,23.75) ; FPC1.12 60.18,23.74 v1(59.25,23.74)
  Bottom Layer w0.155: v1(59.25,23.74) 42.01,23.74 arc(41.88,23.79) 41.83,23.92 arc(41.78,24.04) 41.66,24.09 41.5,24.09 arc(41.38,24.04) 41.32,23.92 arc(41.27,23.79) 41.15,23.74 29.72,23.74 v1(29.72,23.75)
FMC_NWE: length 42.1
  Top Layer w0.155: U3.86 29.21,33.2 v1(29.21,23.24) ; v1(58.8,23.24) 60.18,23.24
  Top Layer w0.178: 60.18,23.24 FPC1.11
  Bottom Layer w0.155: v1(29.21,23.24) v1(58.8,23.24)
KEY1: length 18.9
  Top Layer w0.155: U3.34 46.09,12.08 R112.1 46.23,7.87 46.23,7.24 46.51,6.95 46.51,6.31
KEY2: length 16.4
  Top Layer w0.155: SW3.4 39.64,7.1 39.23,7.5 R127.1 39.23,9.77 39.88,10.41 39.88,17.59 U3.33
KEY3: length 19.6
  Top Layer w0.155: SW6.4 32.76,6.74 32.38,7.11 32.38,7.99 R128.1 32.38,9.39 33.02,10.03 34.8,10.03 39.37,14.61 39.37,17.39 U3.32
OSC_IN1: length 7.6
  Top Layer w0.155: C30.2 22.73,20.47 22.73,20.22 24.29,20.22 25.27,21.21 25.5,21.21 27.31,23.02
OSC_OUT1: length 5.5
  Top Layer w0.155: C31.2 26.66,18.78 25.53,19.91 26.16,20.54 26.16,21.16 U3.13
PA5: length 39.4
  Top Layer w0.155: v1(18.8,39.62) 17.59,39.62 17.61,39.65 R113.2 ; U3.29 32.89,21.74 v1(32.89,39.62)
  Bottom Layer w0.155: v1(32.89,39.62) v1(18.8,39.62)
PA11: length 25
  Top Layer w0.155: 56.22,39.62 55.36,39.62 54.86,39.12 v1(54.86,36.19) ; U3.70 37.26,37.21 v1(37.34,37.21)
  Bottom Layer w0.155: v1(37.34,37.21) 48.39,37.21 50.04,35.56 54.23,35.56 v1(54.86,36.19)
PA13: length 37
  Top Layer w0.155: v1(12.19,35.69) 12.19,29.97 11.53,29.31 R8.1 10.15,29.33 USB1.5 6.59,29.33 6.35,29.08 6.35,28.58 6.6,28.33 USB1.7 ; v1(33.91,35.69) 34.32,35.69 U3.72
  Bottom Layer w0.155: v1(33.91,35.69) v1(12.19,35.69)
PA14: length 37.1
  Top Layer w0.155: USB1.6 8.26,28.83 8.51,28.57 8.51,27.83 ; v1(30.99,38.48) 31,38.48 31.9,37.58 ; USB1.8 8.51,27.83 ; 8.51,27.83 10.14,27.83 R10.1 10.16,27.81 12.57,27.81 13.08,28.32 v1(13.08,38.48)
  Bottom Layer w0.155: v1(30.99,38.48) v1(13.08,38.48)
PB3: length 23.2
  Top Layer w0.155: 27.31,32.98 26.29,34 26.29,42.93 30.96,47.6 H1.3
PB4: length 24.1
  Top Layer w0.155: H1.4 28.42,53.24 30.1,51.56 30.1,47.5 25.78,43.18 25.78,33.81 U3.90
PB5: length 25.2
  Top Layer w0.155: U3.91 25.27,33.61 25.27,43.43 29.34,47.5 29.34,50.42 25.97,53.79 H1.5
PB15: length 41.9
  Top Layer w0.155: U3.54 42.48,31.11 43.56,31.11 43.81,30.86 43.81,26.92 44.07,26.67 44.32,26.67 44.53,26.87 44.53,30.81 44.83,31.11 45.34,31.11 45.58,30.88 45.58,30.34 arc(45.5,30.16) 45.32,30.08 45.11,30.08 arc(44.85,29.83) 45.11,29.57 45.32,29.57 arc(45.58,29.32) 45.32,29.07 45.11,29.07 arc(44.85,28.81) 45.11,28.56 45.32,28.56 arc(45.58,28.3) 45.32,28.05 45.11,28.05 arc(44.85,27.8) 45.11,27.54 45.32,27.54 arc(45.58,27.29) 45.32,27.03 45.11,27.03 arc(44.85,26.78) 45.11,26.53 45.32,26.53 arc(45.5,26.45) 45.58,26.27 45.58,25.8 46.14,25.23 arc(46.32,25.16) 46.5,25.23 46.84,25.57 arc(47.2,25.57) 47.2,25.22 46.86,24.88 arc(46.78,24.7) 46.86,24.52 47.12,24.26 v1(48.64,24.26) ; FPC1.15 59.28,25.25 59.06,25.02 v1(59.06,24.38)
  Bottom Layer w0.155: v1(59.06,24.38) 58.93,24.26 54.62,24.26 arc(54.44,24.33) 54.37,24.51 arc(54.11,24.77) 53.86,24.51 arc(53.6,24.26) 53.35,24.51 arc(53.1,24.77) 52.84,24.51 arc(52.59,24.26) 52.34,24.51 arc(52.08,24.77) 51.83,24.51 arc(51.57,24.26) 51.32,24.51 arc(51.06,24.77) 50.81,24.51 arc(50.74,24.33) 50.56,24.26 v1(48.64,24.26)
PC8: length 32.8
  Top Layer w0.155: R20.1 51.3,40.65 51.05,40.89 51.05,42.13 CARD1.7 51.05,42.2 v1(51.05,43.31) ; v1(51.05,36.07) 39.65,36.07 U3.65
  Bottom Layer w0.155: v1(51.05,36.07) 51.05,36.32 arc(51.13,36.5) 51.31,36.58 51.65,36.58 arc(51.91,36.83) 51.65,37.08 51.31,37.08 arc(51.05,37.34) 51.31,37.59 51.65,37.59 arc(51.91,37.85) 51.65,38.1 51.31,38.1 arc(51.05,38.35) 51.31,38.61 51.65,38.61 arc(51.91,38.86) 51.65,39.12 51.31,39.12 arc(51.05,39.37) 51.31,39.62 51.65,39.62 arc(51.91,39.88) 51.65,40.13 51.31,40.13 arc(51.05,40.39) 51.31,40.64 51.65,40.64 arc(51.91,40.89) 51.65,41.15 51.31,41.15 arc(51.05,41.4) 51.31,41.66 51.65,41.66 arc(51.91,41.91) 51.65,42.16 51.31,42.16 arc(51.13,42.24) 51.05,42.42 v1(51.05,43.31)
PC9: length 30.2
  Top Layer w0.155: U3.66 39.45,36.58 40.26,36.58 arc(40.44,36.65) 40.51,36.83 40.51,36.88 arc(40.77,37.14) 41.02,36.88 41.02,36.83 arc(41.27,36.58) 41.53,36.83 41.53,36.88 arc(41.78,37.14) 42.04,36.88 42.04,36.83 arc(42.29,36.58) 42.54,36.83 42.54,36.88 arc(42.8,37.14) 43.05,36.88 43.05,36.83 arc(43.31,36.58) 43.56,36.83 43.56,36.88 arc(43.81,37.14) 44.07,36.88 44.07,36.83 arc(44.32,36.58) 44.58,36.83 44.58,36.88 arc(44.83,37.14) 45.08,36.88 45.08,36.83 arc(45.34,36.58) 45.59,36.83 45.59,36.88 arc(45.85,37.14) 46.1,36.88 46.1,36.83 arc(46.35,36.58) 46.61,36.83 46.61,36.88 arc(46.86,37.14) 47.12,36.88 47.12,36.83 arc(47.37,36.58) 47.62,36.83 47.62,36.88 arc(47.88,37.14) 48.13,36.88 48.13,36.83 arc(48.21,36.65) 48.39,36.58 53.85,36.58 54.23,36.96 54.23,39.5 53.95,39.77 R19.1 52.84,40.51 52.12,41.23 CARD1.8
PC10: length 32.9
  Top Layer w0.155: U3.78 30.35,37.72 30.35,40.39 30.69,40.72 arc(30.87,40.8) 31.05,40.72 31.64,40.13 arc(32,40.13) 32,40.49 31.41,41.08 arc(31.41,41.44) 31.77,41.44 32.36,40.85 arc(32.72,40.85) 32.72,41.21 32.13,41.8 arc(32.13,42.16) 32.49,42.16 33.08,41.57 arc(33.44,41.57) 33.44,41.93 32.84,42.52 arc(32.85,42.88) 33.2,42.88 33.8,42.28 arc(34.16,42.28) 34.16,42.64 33.56,43.24 arc(33.49,43.42) 33.56,43.6 34.04,44.07 43.94,44.07 44.42,43.59 CARD1.1 44.42,41.37 43.43,40.38 R18.1
PC11: length 32.7
  Top Layer w0.155: U3.79 29.72,37.65 29.72,40.64 30.08,41 arc(30.15,41.18) 30.08,41.36 29.74,41.7 arc(29.74,42.06) 30.1,42.06 30.44,41.72 arc(30.8,41.72) 30.8,42.08 30.46,42.42 arc(30.46,42.78) 30.82,42.78 31.16,42.44 arc(31.52,42.44) 31.52,42.8 31.18,43.14 arc(31.18,43.5) 31.54,43.5 31.88,43.16 arc(32.23,43.16) 32.23,43.52 31.9,43.86 arc(31.9,44.21) 32.25,44.21 32.59,43.88 arc(32.77,43.8) 32.95,43.88 33.53,44.45 44.96,44.45 45.52,43.89 CARD1.2 45.52,41.07 44.96,40.52 R17.1
PC12: length 33.2
  Top Layer w0.155: 30.51,36.15 29.22,37.45 29.22,42.87 31.17,44.83 47.52,44.83 47.85,44.5 arc(48.03,44.43) 48.21,44.5 48.3,44.59 arc(48.66,44.59) 48.66,44.23 48.57,44.14 arc(48.5,43.96) 48.57,43.78 48.82,43.54 CARD1.5 48.82,41.1 49.77,40.15 R38.1
PD2: length 32.9
  Top Layer w0.155: v1(46.61,43.18) 46.61,42.18 CARD1.3 46.62,39.9 R37.1 ; U3.83 28.7,35.83 28.7,43.31 30.74,45.35 v1(46.61,45.35)
  Bottom Layer w0.155: v1(46.61,45.35) v1(46.61,43.18)
PD6: length 24
  Top Layer w0.155: 28.01,33.69 27.31,34.4 27.31,42.55 36.04,51.28 H1.1
PD7: length 23.6
  Top Layer w0.155: H1.2 33.5,49.38 26.8,42.67 26.8,34.2 U3.88
RESET: length 39.5
  Top Layer w0.155: 28.01,22.31 27.31,21.6 27.31,20.7 v1(28.51,19.49) ; SW2.2 7.39,2.82 7.81,3.24 C32.2 7.81,6.92 10.16,9.27 v1(10.16,16.64)
  Bottom Layer w0.155: v1(10.16,16.64) 26.8,16.64 28.51,18.35 v1(28.51,19.49)
STDBY: length 18.4
  Top Layer w0.155: U11.6 v1(14.6,51.94) ; v1(3.81,51.31) 2.57,51.31 R92.1
  Bottom Layer w0.155: v1(3.81,51.31) 3.81,49.15 4.06,48.89 14.1,48.89 14.6,49.4 v1(14.6,51.94)
$1N1164: length 2.3
  Top Layer w0.155: C21.1 34.84,36.87 U3.73
$1N1165: length 2.4
  Top Layer w0.155: U3.48 42.54,25.53 42.54,24.89 43.11,24.32 C24.2
$1N1173: length 3
  Top Layer w0.381: L3.2 C26.2 28.05,17.39 27.93,17.39
$2N523: length 9.1
  Top Layer w0.155: v1(21.97,45.08) 21.97,46.19 U29.1 ; v1(17.63,45.72) C101.1 17.91,46.71 U29.13 ; 18.41,46.74 18.41,47.12 18.51,47.21 U29.12
  Bottom Layer w0.155: v1(21.97,45.08) 18.26,45.08 v1(17.63,45.72)
$2N525: length 2.7
  Top Layer w0.155: U29.14 19.09,45.12 18.75,44.79 R123.2
$2N529: length 3.3
  Top Layer w0.155: U29.3 22.39,47.21 23.12,46.47 R124.1
$2N1598: length 2
  Top Layer w0.155: 7.29,53.21 5.36,53.21 R3.2
$2N1608: length 1.5
  Top Layer w0.155: U24.1 6.67,44.31 R102.1
$2N1610: length 3.3
  Top Layer w0.155: U23.1 8.2,45.84 R102.2 R101.2
$2N1611: length 5.5
  Top Layer w0.155: U23.3 10.27,43.93 9.03,42.68 R103.2 R100.1
$2N1616: length 1.7
  Top Layer w0.155: Q3.1 12.12,41.66 R103.1
$2N1625: length 1.6
  Top Layer w0.155: LED4.1 1.02,46.58 R91.2
$2N1628: length 1.6
  Top Layer w0.155: R92.2 1.02,49.73 LED3.1
$2N1632: length 2.9
  Top Layer w0.155: 3.11,41.05 3.11,41.97 3.94,42.8 U24.3
$3N1366: length 1.7
  Top Layer w0.254: R36.2 26.82,7.71 26.81,7.7
$3N2103: length 4.6
  Top Layer w0.254: Q2.1 57.78,38.15 R35.2 57.78,41.14 R33.1

## Copper pours and planes (outline as drawn; the poured copper is in the pictures)
5V on Top Layer: 17.07,48.54 19.57,48.54 19.57,47.53 17.07,47.53
GND on Top Layer: -2.79,56.77 69.09,56.77 69.09,-2.92 -2.79,-2.92
GND on Bottom Layer: -3.94,58.67 71.12,58.67 71.12,-4.32 -3.94,-4.32
GND on Inner2: 0.26,55.74 65.74,55.74 65.74,0.26 0.26,0.26
VCC3V3 on Top Layer: 21.57,48.55 28.48,48.55 28.48,47.17 21.57,47.17
VCC3V3 on Top Layer: 55.72,21.35 60.74,21.35 60.74,20.3 55.72,20.3
VCC3V3 on Inner1: 0.26,55.74 65.74,55.74 65.74,0.26 0.26,0.26
K on Top Layer: 57.14,35.91 60.87,35.91 60.87,34.14 57.14,34.14
$1N1173 on Top Layer: 27.3,20.78 31.09,20.78 31.09,16.73 27.3,16.73
$2N530 on Top Layer: 17.76,53.88 19.46,53.88 19.46,48.57 17.76,48.57
$2N531 on Top Layer: 21.59,54 23.51,54 23.51,48.55 21.59,48.55
$3N2101 on Top Layer: 55.59,36.79 57.29,36.79 57.29,34.18 55.59,34.18

Small or netless copper shapes (teardrops, artwork), in the pictures only: 513 on Top Layer, 47 on Bottom Layer, 4 on Inner1, 43 on Inner2

## Text on the board
Top Silkscreen Layer: DAP | UART
